# Altium schematic sheet PFC-Sheet-ch2.SchDoc (part 1 of 3)
size 420 x 297 mm; SheetNumber: 3; SheetTotal: 10
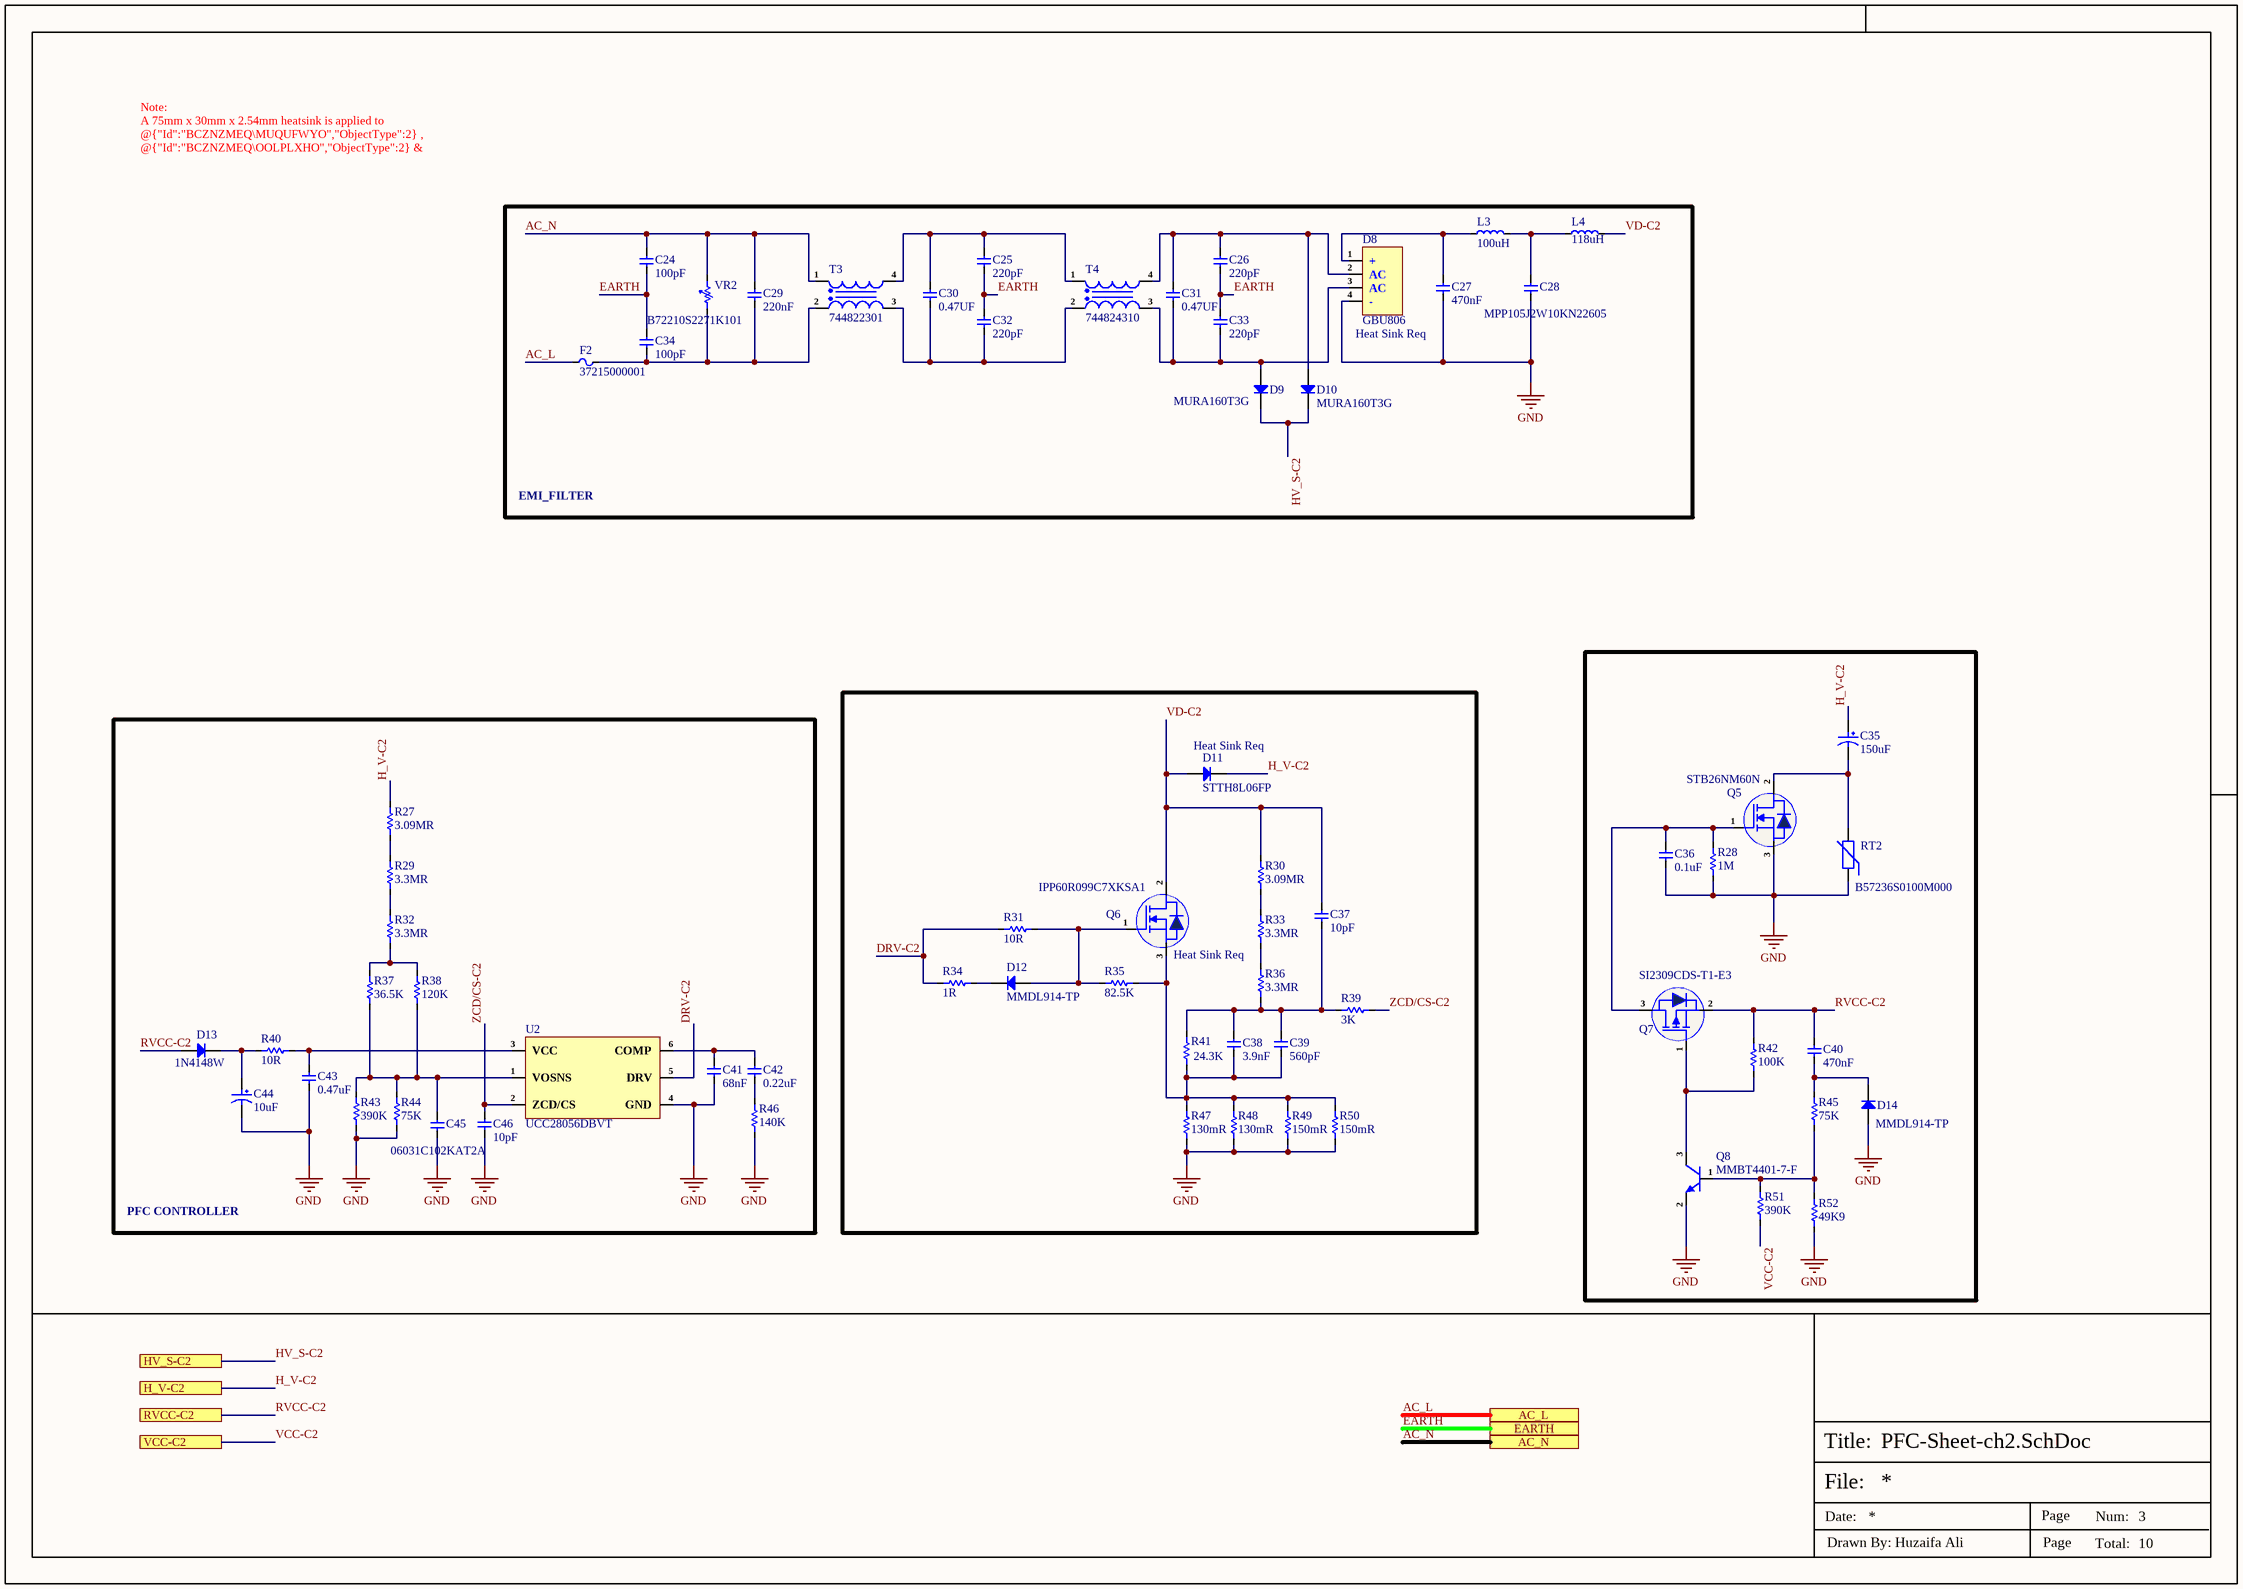
[diagram p0: PFC-Sheet-ch2.SchDoc]

## Parts
C24  100pF  [DE1B3RA101KN4AN01F]
C25  220pF  [DE1B3RA221KN4AN01F]
C26  220pF  [DE1B3RA221KN4AN01F]
C27  470nF  [450MPK474J]
C28  MPP105J2W10KN22605  [MPP105J2W10KN22605]
C29  220nF  [X2P2224KN1B0130150080ES0]
C30  0.47UF  [890324024005]
C31  0.47UF  [890324024005]
C32  220pF  [DE1B3RA221KN4AN01F]
C33  220pF  [DE1B3RA221KN4AN01F]
C34  100pF  [DE1B3RA101KN4AN01F]
C35  150uF  [KN151M45025*30A]
C36  0.1uF  [Cap-0603]
C37  10pF  [Cap-1206]
C38  3.9nF  [Cap-0603]
C39  560pF  [Cap-0603]
C40  470nF  [Cap-1206]
C41  68nF  [Cap-0603]
C42  0.22uF  [Cap-0603]
C43  0.47uF  [Cap-1206]
C44  10uF  [50SVPF10M]
C45  06031C102KAT2A  [Cap-0603]
C46  10pF  [Cap-0603]
D8  GBU806  [GBU]
D9  MURA160T3G  [SMA]
D10  MURA160T3G  [SMA]
D11  STTH8L06FP  [TO-220-2]
D12  MMDL914-TP  [SOD-323]
D13  1N4148W  [SOD-123]
D14  MMDL914-TP  [SOD-323]
F2  37215000001  [37215000001]
L3  100uH  [7447021]
L4  118uH  [760801401]
Q5  STB26NM60N  [TO-263]
Q6  IPP60R099C7XKSA1  [TO-220-3]
Q7  SI2309CDS-T1-E3  [SOT-23]
Q8  MMBT4401-7-F  [SOT-23]
R27  3.09MR  [Res-1206]
R28  1M  [RES-0805]
R29  3.3MR  [Res-1206]
R30  3.09MR  [Res-1206]
R31  10R  [Res-0603]
R32  3.3MR  [Res-1206]
R33  3.3MR  [Res-1206]
R34  1R  [Res-0603]
R35  82.5K  [Res-0603]
R36  3.3MR  [Res-1206]
R37  36.5K  [Res-0603]
R38  120K  [Res-0603]
R39  3K  [Res-0603]
R40  10R  [RES-0805]
R41  24.3K  [Res-0603]
R42  100K  [Res-0603]
R43  390K  [Res-0603]
R44  75K  [Res-0603]
R45  75K  [Res-0603]
R46  140K  [Res-0603]
R47  130mR  [Res-1206]
R48  130mR  [Res-1206]
R49  150mR  [Res-1206]
R50  150mR  [Res-1206]
R51  390K  [Res-0603]
R52  49K9  [Res-0603]
RT2  B57236S0100M000  [B57236S0100M000]
T3  744822301  [744822301]
T4  744824310  [744824310]
U2  UCC28056DBVT  [SOT-23-6]
VR2  B72210S2271K101  [B72210S2271K101]

## Blocks framed on the sheet
PFC CONTROLLER: C41-C46 D13 R27 R29 R32 R37 R38 R40 R43 R44 R46 U2

## Ports
AC_L (see Top-Sheet[4A], Connector-Sheet[5D], PFC-Sheet-ch3[4D], PFC-Sheet-ch4[4D], PFC-Sheet[4D]), AC_N (see Top-Sheet[4A], Connector-Sheet[5D], PFC-Sheet-ch3[4D], PFC-Sheet-ch4[4D], PFC-Sheet[4D]), EARTH (see Top-Sheet[4A], Connector-Sheet[5D], PFC-Sheet-ch3[4D], PFC-Sheet-ch4[4D], PFC-Sheet[4D]), H_V-C2 (see Top-Sheet[5A], Power_Controller-Sheet-ch2[4D]), HV_S-C2 (see Top-Sheet[5A], Power_Controller-Sheet-ch2[4D]), RVCC-C2 (see Top-Sheet[5A], Power_Controller-Sheet-ch2[4D]), VCC-C2 (see Top-Sheet[5A], Power_Controller-Sheet-ch2[4D])

## Nets
GND: C27.1 C28.1 C36.1 C41.1 C43.1 C44.2 C45.1 C46.2 D8.4(-) D14.2(A) Q5.3(S) Q8.2(E) R28.1 R43.1 R44.1 R46.1 R47.2 R48.2 R49.1 R50.1 R52.1 RT2.1 U2.4(GND)
AC_L: F2.1 ; port AC_L
AC_N: C24.2 C29.2 T3.1 VR2.2 ; port AC_N
DRV-C2: R31.1 R34.1 U2.5(DRV)
EARTH: C24.1 C25.1 C26.1 C32.2 C33.2 C34.2 ; port EARTH
H_V-C2: C35.1 D11.1(K) R27.2 ; port H_V-C2
HV_S-C2: D9.1(K) D10.1(K) ; port HV_S-C2
RVCC-C2: C40.2 D13.1(A) Q7.2(S) R42.2 ; port RVCC-C2
VCC-C2: R51.1 ; port VCC-C2
VD-C2: C37.2 D11.2(A) L4.2 Q6.2(D) R30.2
ZCD/CS-C2: C46.1 R39.2 U2.2(ZCD/CS)
NetC25_2: C25.2 C30.2 T3.4 T4.1
NetC26_2: C26.2 C31.2 D8.2(AC) D10.2(A) T4.4
NetC27_2: C27.2 D8.1(+) L3.1
NetC28_2: C28.2 L3.2 L4.1
NetC29_1: C29.1 C34.1 F2.2 T3.2 VR2.1
NetC30_1: C30.1 C32.1 T3.3 T4.2
NetC31_1: C31.1 C33.1 D8.3(AC) D9.2(A) T4.3
NetC35_2: C35.2 Q5.2(D) RT2.2
NetC36_2: C36.2 Q5.1(G) Q7.3(D) R28.2
NetC37_1: C37.1 C38.2 C39.2 R36.1 R39.1 R41.2
NetC38_1: C38.1 C39.1 Q6.3(S) R35.2 R41.1 R47.1 R48.1 R49.2 R50.2
NetC40_1: C40.1 D14.1(K) R45.2
NetC41_2: C41.2 C42.2 U2.6(COMP)
NetC42_1: C42.1 R46.2
NetC43_2: C43.2 R40.2 U2.3(VCC)
NetC44_1: C44.1 D13.2(K) R40.1
NetC45_2: C45.2 R37.1 R38.1 R43.2 R44.2 U2.1(VOSNS)
NetD12_1: D12.1(K) R34.2
NetD12_2: D12.2(A) Q6.1(G) R31.2 R35.1
NetQ7_1: Q7.1(G) Q8.3(C) R42.1
NetQ8_1: Q8.1(B) R45.1 R51.2 R52.2
NetR27_1: R27.1 R29.2
NetR29_1: R29.1 R32.2
NetR30_1: R30.1 R33.2
NetR32_1: R32.1 R37.2 R38.2
NetR33_1: R33.1 R36.2

## Notes on the sheet
- Note:
  A 75mm x 30mm x 2.54mm heatsink is applied to @{"Id":"BCZNZMEQ\MUQUFWYO","ObjectType":2} , @{"Id":"BCZNZMEQ\OOLPLXHO","ObjectType":2} & @{"Id":"BCZNZMEQ\NEQARWQM","ObjectType":2}
- Heat Sink Req
- EMI_FILTER
- (near D11) Heat Sink Req
- File:
- Title:
- Date:
- Page
- Num:
- Total:
- Drawn By: Huzaifa Ali